# EAGLE schematic Terry_Nguyen_LAB2_BPF (EAGLE 9.6.2)
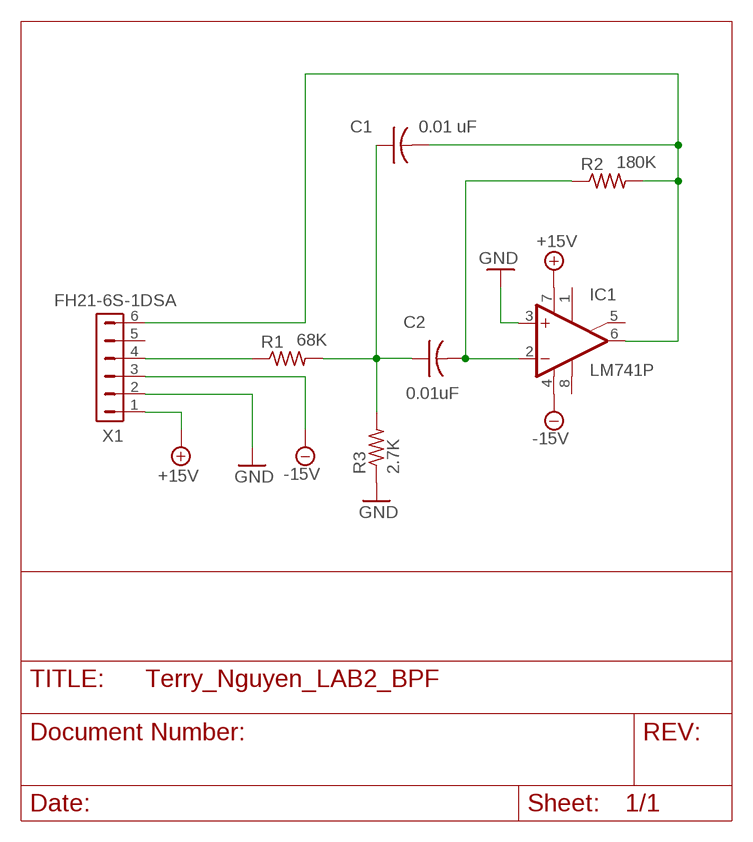
[diagram p0: schematic, sheet 1]

## Parts
C1  0.01 uF  C-US050-025X075  [C050-025X075]
C2  0.01uF  C-US050-025X075  [C050-025X075]
IC1  LM741P  [DIL08]
R1  68K  R-US_0207/10  [0207/10]
R2  180K  R-US_0207/10  [0207/10]
R3  2.7K  R-US_0207/10  [0207/10]
X1  FH21-6S-1DSA  [FH21-6S-1DSA]

## Nets
+15V: IC1.7(V+) X1.1
-15V: IC1.4(V-) X1.3
GND: IC1.3(+IN) R3.1 X1.2
N$1: R1.1 X1.4
N$2: C1.1 C2.1 R1.2 R3.2
N$3: C2.2 IC1.2(-IN) R2.1
N$4: C1.2 IC1.6(OUT) R2.2 X1.6
Unconnected: IC1.1(ON1) IC1.5(ON2) IC1.8(OPT) X1.5

## Library data of the parts
C1 C2 = rcl:C-US: CAPACITOR, American symbol; SPICEPREFIX: C
IC1 = linear:*741: OP AMP
R1-R3 = rcl:R-US_: RESISTOR, American symbol; SPICEPREFIX: R
X1 = con-hirose:FH21-6S-1DSA: FPC CONNECTOR Source: con-hirose.lbr from Bob Starr <rtzaudio@mindspring.com>; OC_FARNELL: unknown; OC_NEWARK: unknown